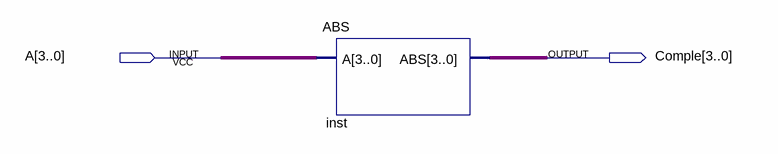
[diagram p0: schematic sheet]
// Quartus schematic test.bdf as structural Verilog: 1 symbols, 2 pins
module test (
  input  [3:0] A,
  output [3:0] Comple
);

  ABS inst (.A(A), .ABS(Comple));
endmodule
